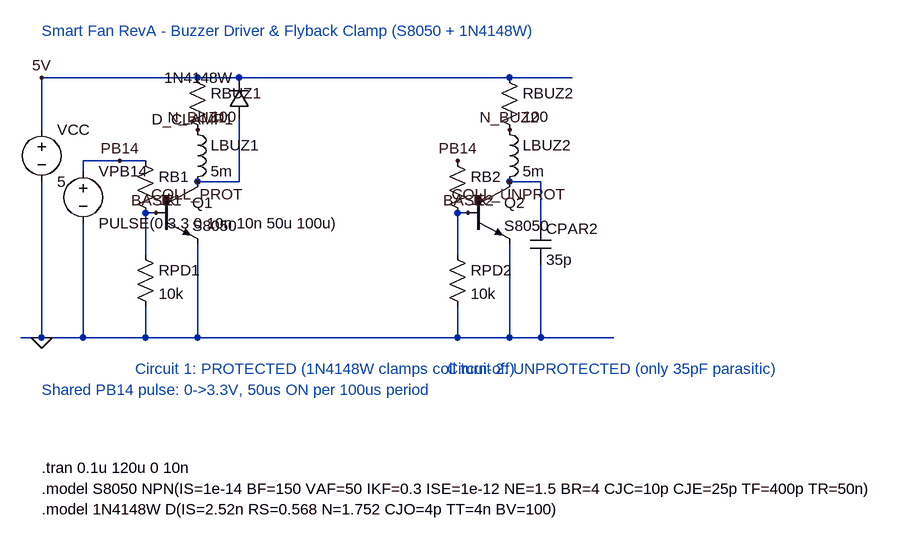
[diagram p0: schematic buzzer_flyback.asc]
buzzer_flyback.asc, the LTspice schematic file:
Version 4
SHEET 1 1100 820
WIRE 96 112 912 112
WIRE 64 512 976 512
WIRE 96 112 96 192
WIRE 96 272 96 512
WIRE 160 240 256 240
WIRE 160 240 160 256
WIRE 160 336 160 512
WIRE 256 320 272 320
WIRE 256 320 256 384
WIRE 256 464 256 512
WIRE 336 368 336 512
WIRE 336 272 400 272
WIRE 400 272 400 176
WIRE 736 320 752 320
WIRE 736 320 736 384
WIRE 736 464 736 512
WIRE 816 368 816 512
WIRE 816 272 864 272
WIRE 864 272 864 336
WIRE 864 400 864 512
FLAG 96 112 5V
FLAG 96 512 0
FLAG 216 240 PB14
FLAG 736 240 PB14
FLAG 272 320 BASE1
FLAG 336 192 N_BUZ1
FLAG 336 272 COLL_PROT
FLAG 752 320 BASE2
FLAG 816 192 N_BUZ2
FLAG 816 272 COLL_UNPROT
SYMBOL voltage 96 176 R0
SYMATTR InstName VCC
SYMATTR Value 5
SYMBOL voltage 160 240 R0
SYMATTR InstName VPB14
SYMATTR Value PULSE(0 3.3 0 10n 10n 50u 100u)
SYMBOL res 240 224 R0
SYMATTR InstName RB1
SYMATTR Value 1k
SYMBOL res 240 368 R0
SYMATTR InstName RPD1
SYMATTR Value 10k
SYMBOL npn 272 272 R0
SYMATTR InstName Q1
SYMATTR Value S8050
SYMBOL res 320 96 R0
SYMATTR InstName RBUZ1
SYMATTR Value 100
SYMBOL ind 320 176 R0
SYMATTR InstName LBUZ1
SYMATTR Value 5m
SYMBOL diode 416 176 R180
SYMATTR InstName D_CLAMP1
SYMATTR Value 1N4148W
SYMBOL res 720 224 R0
SYMATTR InstName RB2
SYMATTR Value 1k
SYMBOL res 720 368 R0
SYMATTR InstName RPD2
SYMATTR Value 10k
SYMBOL npn 752 272 R0
SYMATTR InstName Q2
SYMATTR Value S8050
SYMBOL res 800 96 R0
SYMATTR InstName RBUZ2
SYMATTR Value 100
SYMBOL ind 800 176 R0
SYMATTR InstName LBUZ2
SYMATTR Value 5m
SYMBOL cap 848 336 R0
SYMATTR InstName CPAR2
SYMATTR Value 35p
TEXT 96 40 Left 2 ;Smart Fan RevA - Buzzer Driver & Flyback Clamp (S8050 + 1N4148W)
TEXT 240 560 Left 2 ;Circuit 1: PROTECTED (1N4148W clamps coil turn-off)
TEXT 720 560 Left 2 ;Circuit 2: UNPROTECTED (only 35pF parasitic)
TEXT 96 592 Left 2 ;Shared PB14 pulse: 0->3.3V, 50us ON per 100us period
TEXT 96 712 Left 2 !.tran 0.1u 120u 0 10n
TEXT 96 744 Left 2 !.model S8050 NPN(IS=1e-14 BF=150 VAF=50 IKF=0.3 ISE=1e-12 NE=1.5 BR=4 CJC=10p CJE=25p TF=400p TR=50n)
TEXT 96 776 Left 2 !.model 1N4148W D(IS=2.52n RS=0.568 N=1.752 CJO=4p TT=4n BV=100)

The netlist it stands for:
* buzzer_flyback.asc
VCC 5V 0 5
VPB14 PB14 0 PULSE(0 3.3 0 10n 10n 50u 100u)
RB1 PB14 BASE1 1k
RPD1 BASE1 0 10k
Q1 COLL_PROT BASE1 0 0 S8050
RBUZ1 5V N_BUZ1 100
LBUZ1 N_BUZ1 COLL_PROT 5m
D_CLAMP1 COLL_PROT 5V 1N4148W
RB2 PB14 BASE2 1k
RPD2 BASE2 0 10k
Q2 COLL_UNPROT BASE2 0 0 S8050
RBUZ2 5V N_BUZ2 100
LBUZ2 N_BUZ2 COLL_UNPROT 5m
CPAR2 COLL_UNPROT 0 35p
.model D D
.lib standard.dio
.model NPN NPN
.model PNP PNP
.lib standard.bjt
* Smart Fan RevA - Buzzer Driver & Flyback Clamp (S8050 + 1N4148W)
* Circuit 1: PROTECTED (1N4148W clamps coil turn-off)
* Circuit 2: UNPROTECTED (only 35pF parasitic)
* Shared PB14 pulse: 0->3.3V, 50us ON per 100us period
.tran 0.1u 120u 0 10n
.model S8050 NPN(IS=1e-14 BF=150 VAF=50 IKF=0.3 ISE=1e-12 NE=1.5 BR=4 CJC=10p CJE=25p TF=400p TR=50n)
.model 1N4148W D(IS=2.52n RS=0.568 N=1.752 CJO=4p TT=4n BV=100)
.backanno
.end